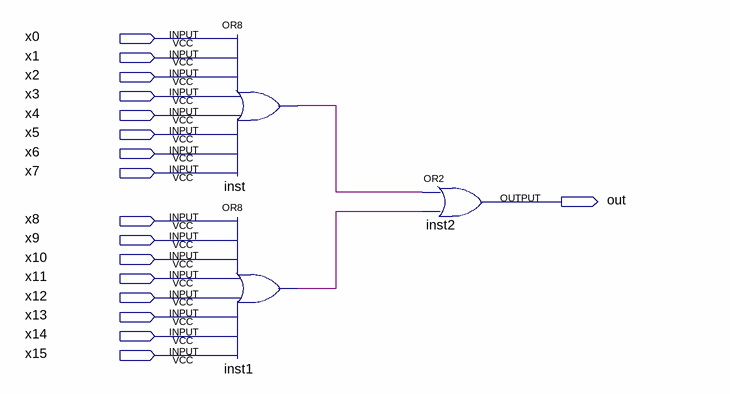
[diagram p0: schematic sheet]
// Quartus schematic orc16w1.bdf as structural Verilog: 3 symbols, 17 pins
module orc16w1 (
  input  x0,
  input  x1,
  input  x2,
  input  x3,
  input  x4,
  input  x5,
  input  x6,
  input  x7,
  input  x8,
  input  x9,
  input  x10,
  input  x11,
  input  x12,
  input  x13,
  input  x14,
  input  x15,
  output out
);

  wire inst1_out, inst_out;

  or inst (inst_out, x0, x1, x2, x3, x4, x5, x6, x7);
  or inst1 (inst1_out, x8, x9, x10, x11, x12, x13, x14, x15);
  or inst2 (out, inst_out, inst1_out);
endmodule
